# Altium schematic sheet ADC_Driver.SchDoc
size 297 x 209 mm
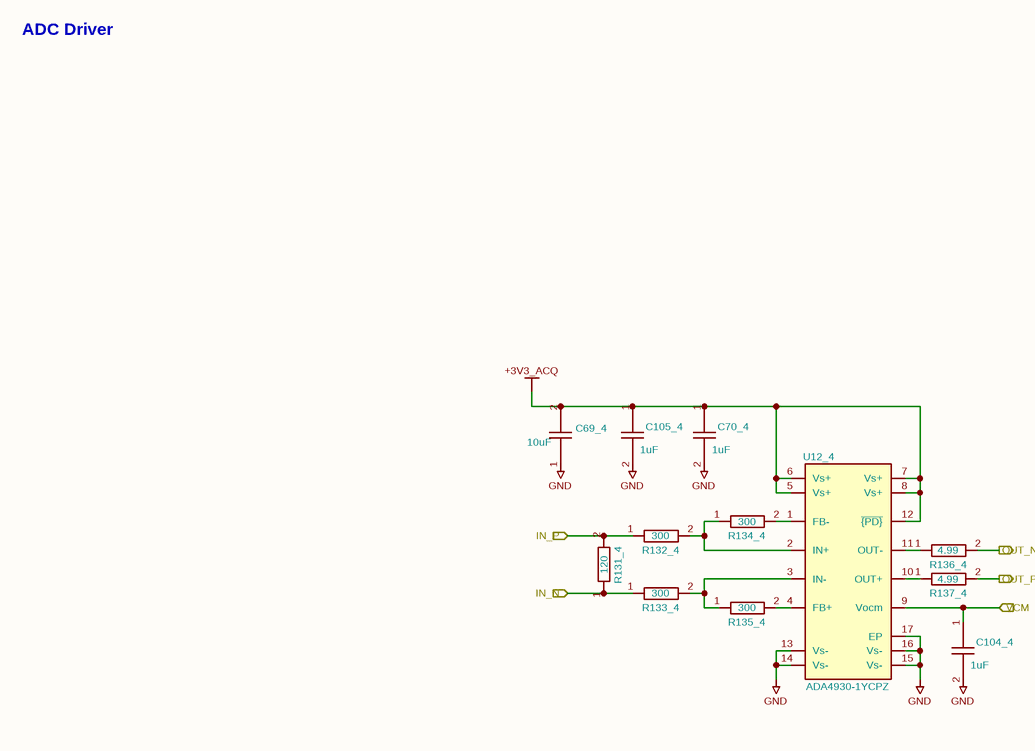
[diagram p0: ADC_Driver.SchDoc]

## Parts
C69_4  10uF  [GEN_C_0603]
C70_4  1uF  [GEN_C_0402]
C104_4  1uF  [GEN_C_0402]
C105_4  1uF  [GEN_C_0402]
R131_4  120  [GEN_R_0402]
R132_4  300  [GEN_R_0402]
R133_4  300  [GEN_R_0402]
R134_4  300  [GEN_R_0402]
R135_4  300  [GEN_R_0402]
R136_4  4.99  [GEN_R_0402]
R137_4  4.99  [GEN_R_0402]
U12_4  ADA4930-1YCPZ  [AD_QFN16_CP-16-21]

## Ports
IN_N (in), IN_P (in), OUT_N (out), OUT_P (out), VCM (in)

## Nets
+3V3_ACQ: C69_4.2 C70_4.1 C105_4.1 U12_4.5(Vs+) U12_4.6(Vs+) U12_4.7(Vs+) U12_4.8(Vs+) U12_4.12(~{{PD}})
GND: C69_4.1 C70_4.2 C104_4.2 C105_4.2 U12_4.13(Vs-) U12_4.14(Vs-) U12_4.15(Vs-) U12_4.16(Vs-) U12_4.17(EP)
IN_N: R131_4.1 R133_4.1 ; port IN_N
IN_P: R131_4.2 R132_4.1 ; port IN_P
OUT_N: R136_4.2 ; port OUT_N
OUT_P: R137_4.2 ; port OUT_P
VCM: C104_4.1 U12_4.9(Vocm) ; port VCM
NetR132_4_2: R132_4.2 R134_4.1 U12_4.2(IN+)
NetR133_4_2: R133_4.2 R135_4.1 U12_4.3(IN-)
NetR134_4_2: R134_4.2 U12_4.1(FB-)
NetR135_4_2: R135_4.2 U12_4.4(FB+)
NetR136_4_1: R136_4.1 U12_4.11(OUT-)
NetR137_4_1: R137_4.1 U12_4.10(OUT+)

## Notes on the sheet
- ADC Driver
- 1
- 2
- 3
- 4
- 5
- 6
- A
- B
- C
- Aleksa Bjelogrlic
- D
- Title: ThunderScope
- File: ADC_Driver.kicad_sch
- Sheet: /
- EEVengers
- KiCad E.D.A.  kicad (5.1.4)-1
- Size: A4
- Date:
- Rev: 5.3
- Id: 1/1

## Library data of the parts
C69_4 = CAP 10uF 25V X5R 0603: MANUFACTURER: Murata; MANUFACTURER PART NUMBER: GRM188R61E106MA73D; VOLTAGE RATING: 25V; Substitutions Policy: Any Parametric Equivalent; PACKAGE: 0402; SUPPLIER 1: Mouser; SUPPLIER PART NUMBER 1: 81-GRM188R61E106MA3D; Footprint: Thunderscope_Rev5:GEN_C_0603; Value: 10uF
C70_4 C104_4 C105_4 = CAP 1uF 25V X5R 0402: MANUFACTURER: Murata; MANUFACTURER PART NUMBER: GRM155R61E105KA12D; VOLTAGE RATING: 25V; Substitutions Policy: Any Parametric Equivalent; PACKAGE: 0402; SUPPLIER 1: Mouser; SUPPLIER PART NUMBER 1: 81-GRM155R61E105KA2D; Footprint: Thunderscope_Rev5:GEN_C_0402; Value: 1uF
R131_4 = RES 120 OHM 1% 1/16W 0402: MANUFACTURER: Yageo; MANUFACTURER PART NUMBER: RC0402FR-07120RL; TOLERANCE: 1%; Substitutions Policy: Any Parametric Equivalent; PACKAGE: 0402; SUPPLIER 1: Mouser; SUPPLIER PART NUMBER 1: 603-RC0402FR-07120RL; Footprint: Thunderscope_Rev5:GEN_R_0402; Value: 120
R132_4 R133_4 R134_4 R135_4 = RES 300 OHM 0.1% 1/16W 0402: MANUFACTURER: Panasonic; MANUFACTURER PART NUMBER: ERA-2AEB301X; TOLERANCE: 0.1%; Substitutions Policy: ECO Required for Substitution; PACKAGE: 0402; SUPPLIER 1: Mouser; SUPPLIER PART NUMBER 1: 667-ERA-2AEB301X; Footprint: Thunderscope_Rev5:GEN_R_0402; Value: 300
R136_4 R137_4 = RES 4.99 OHM 1% 1/16W 0402: MANUFACTURER: Yageo; MANUFACTURER PART NUMBER: RC0402FR-074R99L; TOLERANCE: 1%; Substitutions Policy: Any Parametric Equivalent; PACKAGE: 0402; SUPPLIER 1: Mouser; SUPPLIER PART NUMBER 1: 603-RC0402FR-074R99L; Footprint: Thunderscope_Rev5:GEN_R_0402; Value: 4.99
U12_4 = IC ADC DRIVER ADA4930-1YCPZ: MANUFACTURER: Analog Devices; MANUFACTURER PART NUMBER: ADA4930-1YCPZ-R7; Substitutions Policy: No Substitutions; SUPPLIER 1: Mouser; SUPPLIER PART NUMBER 1: 584-ADA4930-1YCPZ-R7; PACKAGE: 16-QFN (3x3mm); Footprint: Thunderscope_Rev5:AD_QFN16_CP-16-21; Value: ADA4930-1YCPZ